# EasyEDA Pro project hackbash.eprj

# Schematic hackbash
Board Name: hackbash; Create Date: 2025-10-17; Page Name: hackbash; Project Name: hackbash; Schematic Name: hackbash; Update Date: 2025-10-17; File: hackbash; Id: /; Sheet: /
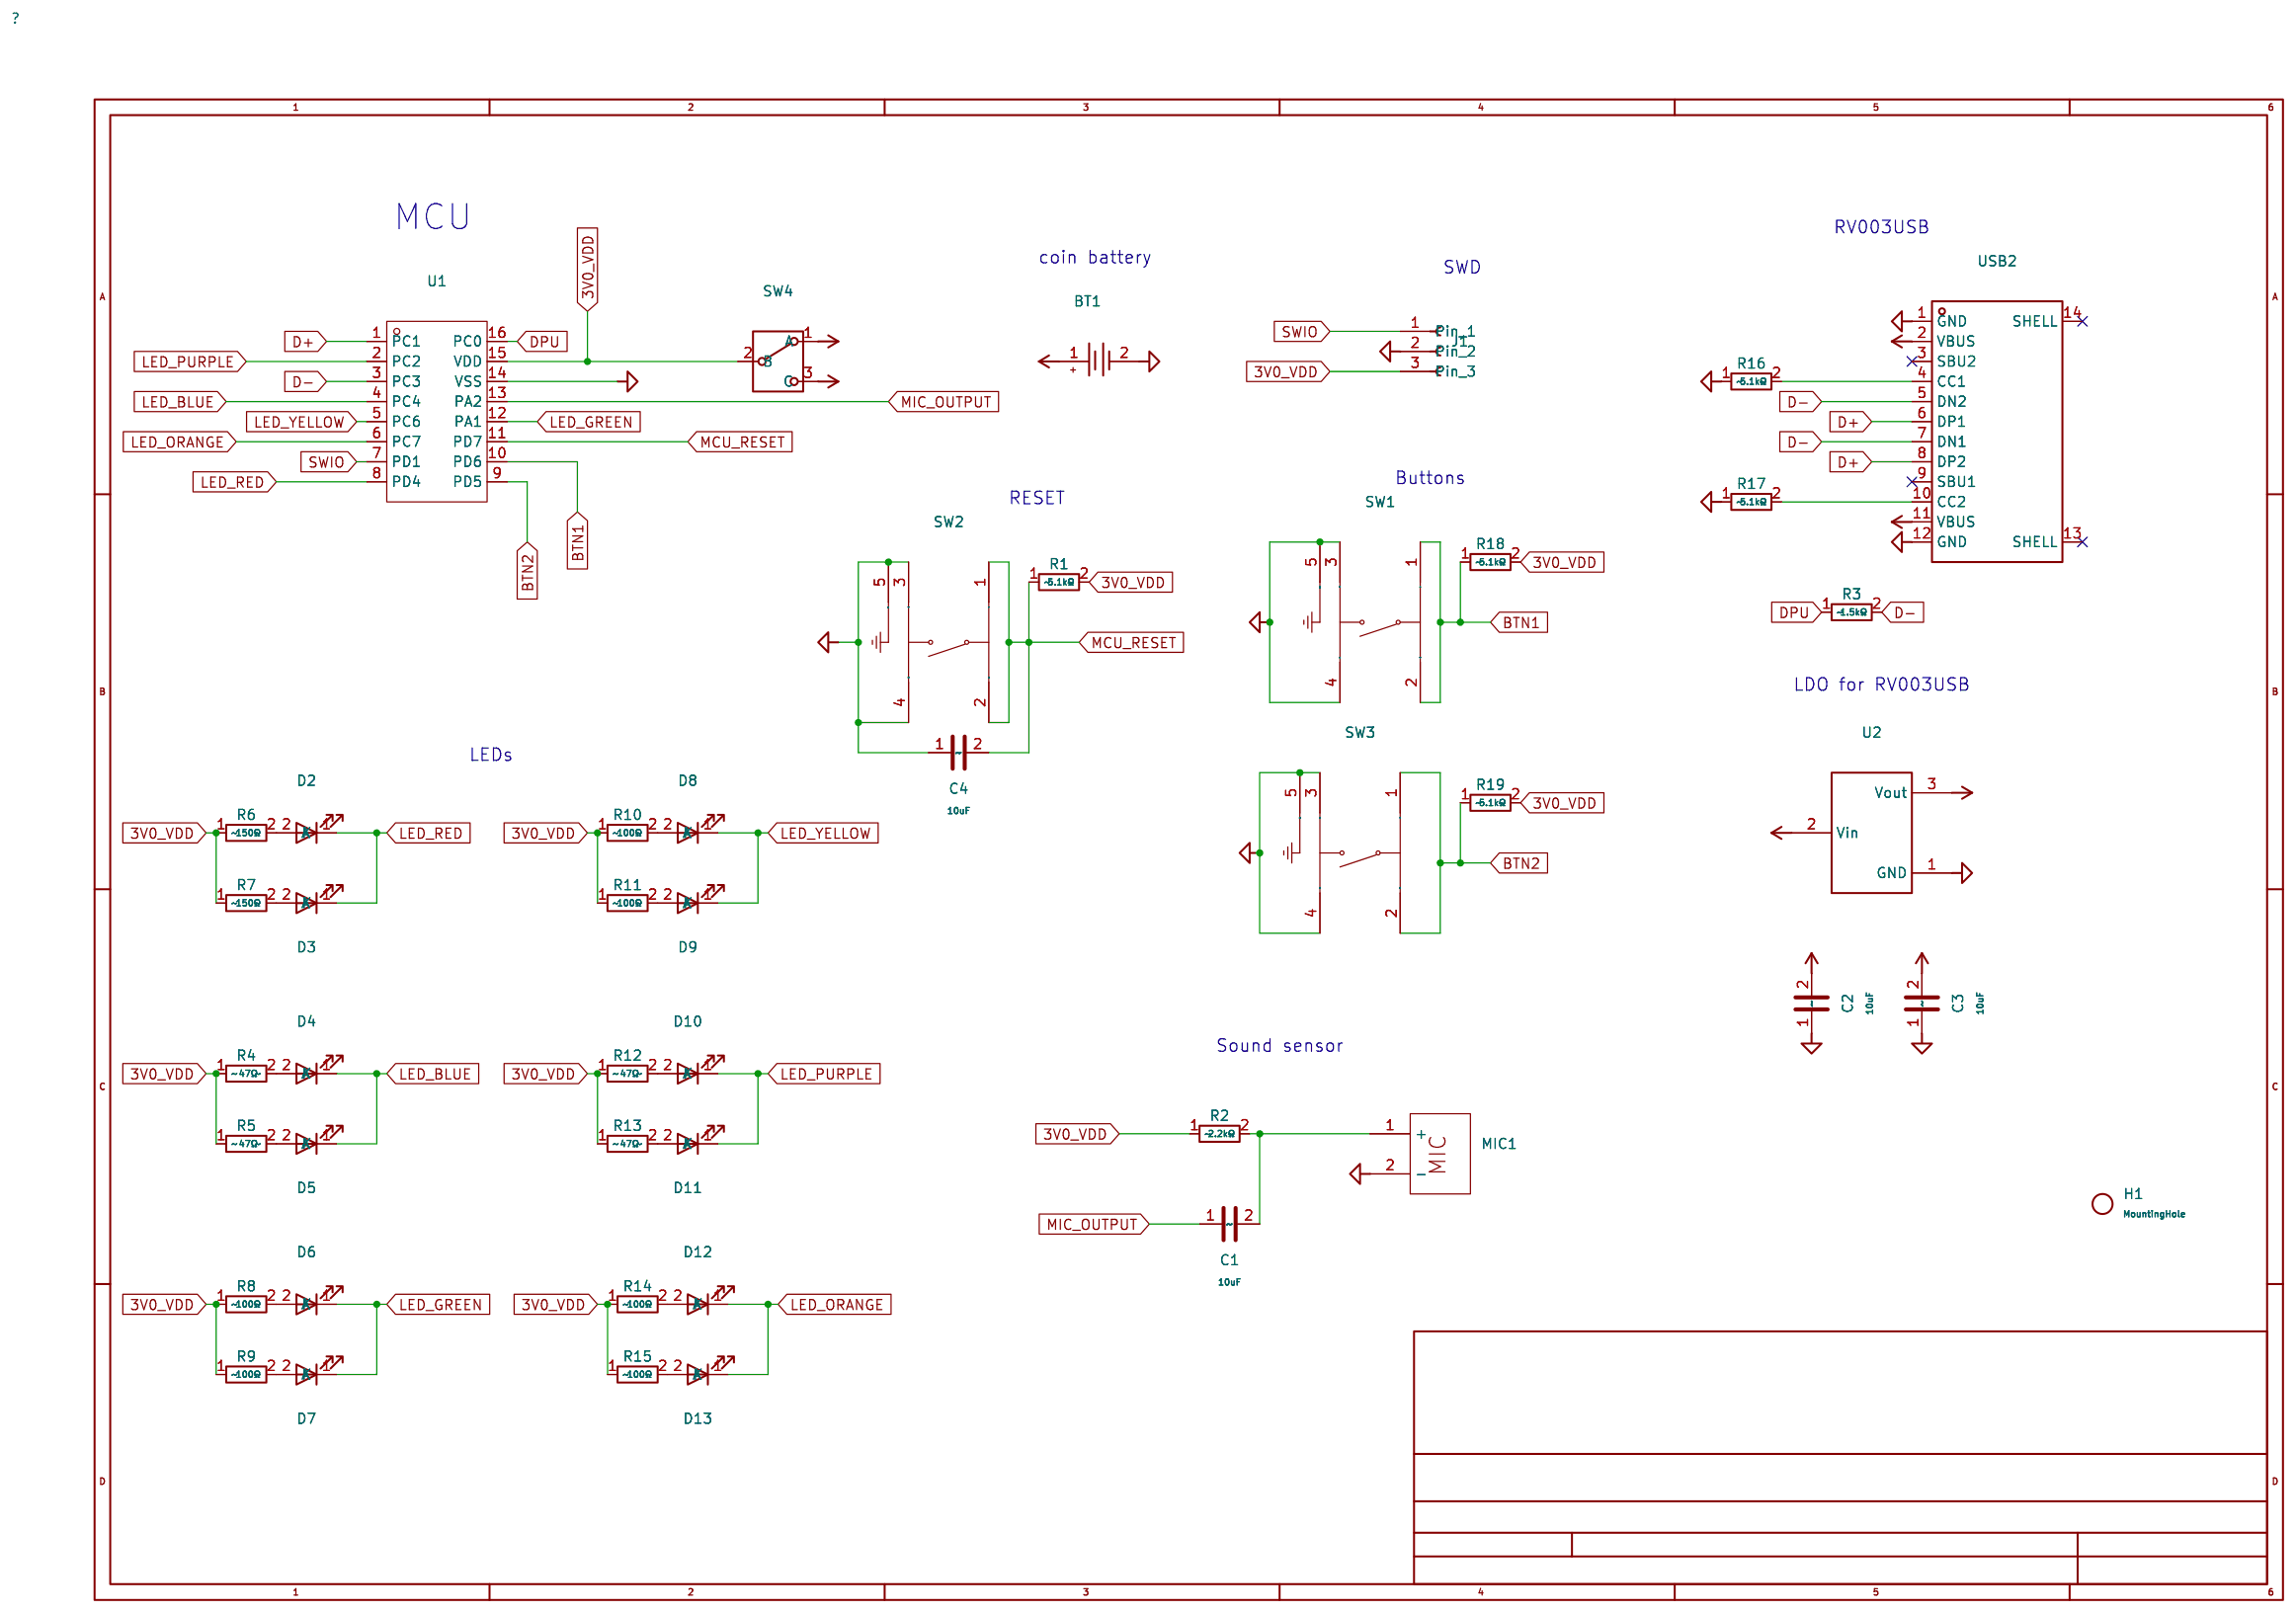
[diagram p0: schematic sheet]

## Parts
BT1  CR2032弯脚电池片铜 3V  [BAT-SMD_CR2032-3V]
C1  10uF  [C0805]
C2  10uF  [C0805]
C3  10uF  [C0805]
C4  10uF  [C0805]
D2  F.0805.00006/P2-0805R1TS2-08T-002  [LED0805-R-RD]
D3  F.0805.00006/P2-0805R1TS2-08T-002  [LED0805-R-RD]
D4  XL-2012UBC-A  [LED-SMD_L2.0-W1.3-RD_XL-2012UGC-DS]
D5  XL-2012UBC-A  [LED-SMD_L2.0-W1.3-RD_XL-2012UGC-DS]
D6  F.0805.00004/P2-0805G2TS2-08T-002  [LED0805-R-RD_GREEN]
D7  F.0805.00004/P2-0805G2TS2-08T-002  [LED0805-R-RD_GREEN]
D8  XL-2012UYC  [LED0805-RD_YELLOW]
D9  XL-2012UYC  [LED0805-RD_YELLOW]
D10  F.0805.00034/P2-0805W7YS2-08T-006  [LED0805-RD]
D11  F.0805.00034/P2-0805W7YS2-08T-006  [LED0805-RD]
D12  XL-2012UOC  [LED0805-RD_ORANGE]
D13  XL-2012UOC  [LED0805-RD_ORANGE]
H1  MountingHole  [MountingHole:MountingHole_3.2mm_M3_DIN965_Pad]
J1  WAFER-XH254WZ-3AL  [CONN-TH_WAFER-XH254WZ-3A]
MIC1  MIC-4013-G-G00  [MIC-SMD_BD4.0-4013_SMDA]
R1  5.1kΩ  [R0805]
R2  2.2kΩ  [R0805]
R3  1.5kΩ  [R0805]
R4  47Ω  [R0805]
R5  47Ω  [R0805]
R6  150Ω  [R0805]
R7  150Ω  [R0805]
R8  100Ω  [R0805]
R9  100Ω  [R0805]
R10  100Ω  [R0805]
R11  100Ω  [R0805]
R12  47Ω  [R0805]
R13  47Ω  [R0805]
R14  100Ω  [R0805]
R15  100Ω  [R0805]
R16  5.1kΩ  [R0805]
R17  5.1kΩ  [R0805]
R18  5.1kΩ  [R0805]
R19  5.1kΩ  [R0805]
SW1  HX TS3315A-H 250gf  [SW-SMD_4P-L3.4-W3.4-P2.00-LS4.0_TS3315A160GF]
SW2  HX TS3315A-H 250gf  [SW-SMD_4P-L3.4-W3.4-P2.00-LS4.0_TS3315A160GF]
SW3  HX TS3315A-H 250gf  [SW-SMD_4P-L3.4-W3.4-P2.00-LS4.0_TS3315A160GF]
SW4  MST-22D18G4-WT  [SW-SMD_MST-22D18G4-WT]
U1  CH32V003A4M6  [SOIC-16_L9.9-W3.9-P1.27-LS6.0-BL]
U2  XC6206P332MR-G  [SOT-23-3_L2.9-W1.6-P1.90-LS2.8-BR]
USB2  TYPE-C 16PIN 2MD(073)  [USB-C-SMD_TYPE-C-6PIN-2MD-073]

## Library data of the parts
BT1 = CR2032弯脚电池片铜 3V: Connector Type:Battery Clip Battery Type:CR2032 Operating Temperature:- Operating Temperature:-; Supplier Part: C70373; Manufacturer: QIJEY; Supplier Footprint: SMD; JLCPCB Part Class: Extended Part; Datasheet: https://item.szlcsc.com/datasheet/CR2032%25E5%25BC%25AF%25E8%2584%259A%25E7%2594%25B5%25E6%25B1%25A0%25E7%2589%2587%25E9%2593%259C%25203V/71468.html; Supplier: LCSC; Connector Type: Battery Clip; Battery Type: CR2032
C1-C4 = CL21A106KAYNNNE_C15850: Capacitance:10uF Tolerance:±10% Tolerance:±10% Voltage Rating:25V Temperature Coefficient:X5R; LCSC Part Name: 10uF ±10% 25V; Supplier Part: C15850; Manufacturer: SAMSUNG(三星); Manufacturer Part: CL21A106KAYNNNE; Supplier Footprint: 0805; JLCPCB Part Class: Basic Part; Datasheet: https://item.szlcsc.com/datasheet/CL21A106KAYNNNE/16532.html; Supplier: LCSC; Tolerance: ±10%; Voltage Rating: 25V; Temperature Coefficient: X5R
D2 D3 = F.0805.00006/P2-0805R1TS2-08T-002: Illumination Color:Red Forward Current:- Lens Color:- Viewing Angle:120° Operating Temperature:-40℃~+85℃ Operating Temperature:-40℃~+85℃; Supplier Part: C7496834; Manufacturer: TUOZHAN(拓展光电); Supplier Footprint: 0805; JLCPCB Part Class: Extended Part; Datasheet: https://item.szlcsc.com/datasheet/F.0805.00006%252FP2-0805R1TS2-08T-002/8563198.html; Supplier: LCSC; Illumination Color: Red; Viewing Angle: 120°; Operating Temperature: -40℃~+85℃
D4 D5 = XL-2012UBC-A_C7371912: Lamp Holder Type:- Illumination Color:Blue Voltage - Forward(Vf):2.6V~2.9V Voltage - Forward(Vf):2.6V~2.9V Power(Watts):100mW Forward Current:5mA Wavelength - Dominant:456nm~476nm Wavelength - Dominant:456nm~476nm Peak Wavelength:465nm Diode Configuration; LCSC Part Name: 0805高亮蓝贴片式发光二极管; Supplier Part: C7371912; Manufacturer: XINGLIGHT(成兴光); Supplier Footprint: 0805; JLCPCB Part Class: Extended Part; Datasheet: https://item.szlcsc.com/datasheet/XL-2012UBC-A/8342984.html; Supplier: LCSC; Illumination Color: Blue; Voltage - Forward(Vf): 2.6V~2.9V; Power(Watts): 100mW; Forward Current: 5mA; Wavelength - Dominant: 456nm~476nm; Peak Wavelength: 465nm; Lens Color: Water Clear; Luminous Intensity: 300mcd; Viewing Angle: 130°; Mounting Style: op View Mount; Operating Temperature: -40℃~+85℃
D6 D7 = F.0805.00004/P2-0805G2TS2-08T-002: Illumination Color:Emerald Green Forward Current:- Lens Color:- Viewing Angle:120° Operating Temperature:-40℃~+85℃ Operating Temperature:-40℃~+85℃; Supplier Part: C7496832; Manufacturer: TUOZHAN(拓展光电); Supplier Footprint: 0805; JLCPCB Part Class: Extended Part; Datasheet: https://item.szlcsc.com/datasheet/F.0805.00004%252FP2-0805G2TS2-08T-002/8563196.html; Supplier: LCSC; Illumination Color: Emerald Green; Viewing Angle: 120°; Operating Temperature: -40℃~+85℃
D8 D9 = XL-2012UYC: Lamp Holder Type:- Illumination Color:Yellow Voltage - Forward(Vf):2.3V Voltage - Forward(Vf):2.3V Power(Watts):50mW Forward Current:20mA Wavelength - Dominant:585nm~595nm Wavelength - Dominant:585nm~595nm Peak Wavelength:590nm Diode Configuration:- Lens; LCSC Part Name: 0805黄贴片式发光二极管; Supplier Part: C965814; Manufacturer: XINGLIGHT(成兴光); Supplier Footprint: 0805; JLCPCB Part Class: Extended Part; Datasheet: https://item.szlcsc.com/datasheet/XL-2012UYC/1051423.html; Supplier: LCSC; Illumination Color: Yellow; Voltage - Forward(Vf): 2.3V; Power(Watts): 50mW; Forward Current: 20mA; Wavelength - Dominant: 585nm~595nm; Peak Wavelength: 590nm; Lens Color: Water Clear; Luminous Intensity: 535mcd; Viewing Angle: 120°; Mounting Style: op View Mount
D10 D11 = F.0805.00034/P2-0805W7YS2-08T-006: Lamp Holder Type:- Illumination Color:Purple Voltage - Forward(Vf):2.6V~3V Voltage - Forward(Vf):2.6V~3V Power(Watts):90mW Forward Current:5mA Wavelength - Dominant:- Wavelength - Dominant:- Peak Wavelength:- Diode Configuration:- Lens Color:Water Clear C; LCSC Part Name: 0805紫罗兰; Supplier Part: C7496841; Manufacturer: TUOZHAN(拓展光电); Supplier Footprint: 0805; JLCPCB Part Class: Extended Part; Datasheet: https://item.szlcsc.com/datasheet/F.0805.00034%252FP2-0805W7YS2-08T-006/8563205.html; Supplier: LCSC; Illumination Color: Purple; Voltage - Forward(Vf): 2.6V~3V; Power(Watts): 90mW; Forward Current: 5mA; Lens Color: Water Clear; Luminous Intensity: 100mcd; Viewing Angle: 120°; Operating Temperature: -40℃~+85℃
D12 D13 = XL-2012UOC: Emitted Color:Orange Forward Voltage (VF):2.3V Forward Voltage (VF):2.3V Power Dissipation:50mW Forward Current:20mA Dominant Wavelength:600nm~610nm Dominant Wavelength:600nm~610nm Peak Wavelength:605nm Lens Color:Colorless transparent lens Color Temperat; Supplier Part: C965813; Manufacturer: XINGLIGHT(成兴光); Supplier Footprint: 0805; JLCPCB Part Class: Extended Part; Datasheet: https://atta.szlcsc.com/upload/public/pdf/source/20240218/D1CE7F0515D7DB5A770105D8481191D9.pdf; Supplier: LCSC; Emitted Color: Orange; Forward Voltage (VF): 2.3V; Power Dissipation: 50mW; Forward Current: 20mA; Dominant Wavelength: 600nm~610nm; Peak Wavelength: 605nm; Lens Color: Colorless transparent lens; Luminous Intensity: 330mcd; Viewing Angle: 120°; Mounting Sytle: Positive Stick; Operating Temperature: -20℃~+85℃
H1 = Mechanical_MountingHole: Mounting Hole without connection; Users: REF**
J1 = WAFER-XH254WZ-3AL: Pins Structure:1x3P Pitch:2.54mm Mounting Type:Right Angle Reference Series:XH Number of Pins:3P Number of Rows:1 Number of PINs Per Row:3 Current Rating:3A Contact Material:Brass Operating Temperature:-25℃~+85℃ Operating Temperature:-25℃~+85℃ Voltage Rat; LCSC Part Name: 1x3P 间距:2.54mm 弯插 系列:XH; Supplier Part: C22751805; Manufacturer: HANBO(汉博); Supplier Footprint: 弯插,P=2.54mm; JLCPCB Part Class: Extended Part; Datasheet: https://item.szlcsc.com/datasheet/WAFER-XH254WZ-3AL/24478740.html; Supplier: LCSC; Pins Structure: 1x3P; Pitch: 2.54mm; Mounting Type: Right Angle; Reference Series: XH; Number of Pins: 3P; Number of Rows: 1; Number of PINs Per Row: 3; Current Rating: 3A; Contact Material: Brass; Operating Temperature: -25℃~+85℃; Voltage Rating: 250V; Plastic Material: PA66; Flame Retardant Rating: UL94V-0
MIC1 = MIC-4013-G-G00: Supplier Part: C42371093; Manufacturer: SAMZO(三佐); Supplier Footprint: SMD,D=4mm; JLCPCB Part Class: Extended Part; Datasheet: https://item.szlcsc.com/datasheet/MIC-4013-G-G00/44248913.html; Supplier: LCSC
R1 R16-R19 = 0805W8F5101T5E: Type:Thick Film Resistor Resistance:5.1kΩ Tolerance:±1% Tolerance:±1% Power(Watts):125mW Voltage-Supply(Max):150V Temperature Coefficient:±100ppm/℃ Temperature Coefficient:±100ppm/℃ Operating Temperature:-55℃~+155℃ Operating Temperature:-55℃~+155℃; LCSC Part Name: 5.1kΩ ±1% 125mW 厚膜电阻; Supplier Part: C27834; Manufacturer: UNI-ROYAL(厚声); Supplier Footprint: 0805; JLCPCB Part Class: Basic Part; Datasheet: https://item.szlcsc.com/datasheet/0805W8F5101T5E/28584.html; Supplier: LCSC; Type: Thick Film Resistor; Tolerance: ±1%; Power(Watts): 125mW; Voltage-Supply(Max): 150V; Temperature Coefficient: ±100ppm/℃; Operating Temperature: -55℃~+155℃
R2 = 0805W8F2201T5E_C17520: Type:Thick Film Resistors Resistance:2.2kΩ Tolerance:±1% Tolerance:±1% Power(Watts): Overload Voltage (Max): Temperature Coefficient:±100ppm/℃ Temperature Coefficient:±100ppm/℃ Operating Temperature Range:-55℃~+155℃ Operating Temperature Range:-55℃~+155℃; LCSC Part Name: 2.2kΩ ±1% 125mW 厚膜电阻; Supplier Part: C17520; Manufacturer: UNI-ROYAL(厚声); Manufacturer Part: 0805W8F2201T5E; Supplier Footprint: 0805; JLCPCB Part Class: Basic Part; Datasheet: https://atta.szlcsc.com/upload/public/pdf/source/20200306/C422600_1E6D84923E4A46A82E41ADD87F860B5C.pdf; Supplier: LCSC; Type: Thick Film Resistors; Tolerance: ±1%; Temperature Coefficient: ±100ppm/℃; Operating Temperature Range: -55℃~+155℃
R3 = 0805W8F1501T5E: Type:Thick Film Resistors Resistance:1.5kΩ Tolerance:±1% Tolerance:±1% Power(Watts): Overload Voltage (Max): Temperature Coefficient:±100ppm/℃ Temperature Coefficient:±100ppm/℃ Operating Temperature Range:-55℃~+155℃ Operating Temperature Range:-55℃~+155℃; LCSC Part Name: 1.5kΩ ±1% 125mW 厚膜电阻; Supplier Part: C4310; Manufacturer: UNI-ROYAL(厚声); Supplier Footprint: 0805; JLCPCB Part Class: Basic Part; Datasheet: https://atta.szlcsc.com/upload/public/pdf/source/20200306/C422600_1E6D84923E4A46A82E41ADD87F860B5C.pdf; Supplier: LCSC; Type: Thick Film Resistors; Tolerance: ±1%; Temperature Coefficient: ±100ppm/℃; Operating Temperature Range: -55℃~+155℃
R4 R5 R12 R13 = 0805W8F470JT5E: Type:Thick Film Resistor Resistance:47Ω Tolerance:±1% Tolerance:±1% Power(Watts):125mW Voltage-Supply(Max):150V Temperature Coefficient:±100ppm/℃ Temperature Coefficient:±100ppm/℃ Operating Temperature:-55℃~+155℃ Operating Temperature:-55℃~+155℃; LCSC Part Name: 47Ω ±1% 125mW 厚膜电阻; Supplier Part: C17714; Manufacturer: UNI-ROYAL(厚声); Supplier Footprint: 0805; JLCPCB Part Class: Basic Part; Datasheet: https://item.szlcsc.com/datasheet/0805W8F470JT5E/18402.html; Supplier: LCSC; Type: Thick Film Resistor; Tolerance: ±1%; Power(Watts): 125mW; Voltage-Supply(Max): 150V; Temperature Coefficient: ±100ppm/℃; Operating Temperature: -55℃~+155℃
R6 R7 = 0805W8F1500T5E: Type:Thick Film Resistor Resistance:150Ω Tolerance:±1% Tolerance:±1% Power(Watts):125mW Voltage-Supply(Max):150V Temperature Coefficient:±100ppm/℃ Temperature Coefficient:±100ppm/℃ Operating Temperature:-55℃~+155℃ Operating Temperature:-55℃~+155℃; LCSC Part Name: 150Ω ±1% 125mW 厚膜电阻; Supplier Part: C17471; Manufacturer: UNI-ROYAL(厚声); Supplier Footprint: 0805; JLCPCB Part Class: Basic Part; Datasheet: https://item.szlcsc.com/datasheet/0805W8F1500T5E/18159.html; Supplier: LCSC; Type: Thick Film Resistor; Tolerance: ±1%; Power(Watts): 125mW; Voltage-Supply(Max): 150V; Temperature Coefficient: ±100ppm/℃; Operating Temperature: -55℃~+155℃
R8-R11 R14 R15 = 0805W8F1000T5E_C17408: Type:Thick Film Resistors Resistance: Tolerance:±1% Tolerance:±1% Power(Watts): Overload Voltage (Max): Temperature Coefficient:±100ppm/℃ Temperature Coefficient:±100ppm/℃ Operating Temperature Range:-55℃~+155℃ Operating Temperature Range:-55℃~+155℃; LCSC Part Name: 100Ω ±1% 125mW 厚膜电阻; Supplier Part: C17408; Manufacturer: UNI-ROYAL(厚声); Manufacturer Part: 0805W8F1000T5E; Supplier Footprint: 0805; JLCPCB Part Class: Basic Part; Datasheet: https://atta.szlcsc.com/upload/public/pdf/source/20200306/C422600_1E6D84923E4A46A82E41ADD87F860B5C.pdf; Supplier: LCSC; Type: Thick Film Resistors; Tolerance: ±1%; Temperature Coefficient: ±100ppm/℃; Operating Temperature Range: -55℃~+155℃
SW1-SW3 = HX TS3315A-H 250gf: Switch Length:3.1mm Switch Width:3.1mm Switch Height:1.5mm Mechanical Life:-; LCSC Part Name: 3.1*3.1*1.5mm 立贴 轻触开关; Supplier Part: C5143623; Manufacturer: hanxia(韩下); Supplier Footprint: SMD; JLCPCB Part Class: Extended Part; Datasheet: https://atta.szlcsc.com/upload/public/pdf/source/20220824/BDB19683E1006CDC20D6384D0C56BE08.pdf; Supplier: LCSC; Switch Length: 3.1mm; Switch Width: 3.1mm; Switch Height: 1.5mm
SW4 = MST-22D18G4-WT: Circuit:DPDT Actuator Style:Rectangular column Termination Style:SMDSplicing Mounting Type:Horizontal attachment Current Rating:100mA Voltage Rating:12V Life:10,000 times Operating Temperature:-10℃~+50℃ Operating Temperature:-10℃~+50℃; LCSC Part Name: 两档卧式贴片 6脚拨动 柄长4MM; Supplier Part: C7507448; Manufacturer: SHOU HAN(首韩); Supplier Footprint: SMD; JLCPCB Part Class: Extended Part; Datasheet: https://item.szlcsc.com/datasheet/MST-22D18G4-WT/8598470.html; Supplier: LCSC; Circuit: DPDT; Actuator Style: Rectangular column; Termination Style: SMDSplicing; Mounting Type: Horizontal attachment; Current Rating: 100mA; Voltage Rating: 12V; Life: 10,000 times; Operating Temperature: -10℃~+50℃
U1 = CH32V003A4M6: LCSC Part Name: QingKe V2微处理器; Supplier Part: C5346357; Manufacturer: WCH(南京沁恒); Supplier Footprint: SOP-16; JLCPCB Part Class: Extended Part; Datasheet: https://item.szlcsc.com/datasheet/CH32V003A4M6/6127783.html; Supplier: LCSC
U2 = XC6206P332MR-G_C5446: Output Type:Fixed Voltage - Supply:6V Output Voltage:3.3V Output Voltage:3.3V Output Current:200mA Power Supply Rejection Ratio (PSRR):- Voltage Dropout:- standby current:1uA Features:Over Current Protection Operating Temperature:-40℃~+85℃@(Ta) Operating; LCSC Part Name: 输入6V 输出3.3V 200mA; Supplier Part: C5446; Manufacturer: TOREX(特瑞仕); Supplier Footprint: SOT-23-3L; JLCPCB Part Class: Basic Part; Datasheet: https://item.szlcsc.com/datasheet/XC6206P332MR-G/5896.html; Supplier: LCSC; Output Type: Fixed; Voltage - Supply: 6V; Output Voltage: 3.3V; Output Current: 200mA; standby current: 1uA; Features: Over Current Protection; Operating Temperature: -40℃~+85℃@(Ta); Output Configuration: Positive; Number of Outputs: 1
USB2 = TYPE-C 16PIN 2MD(073): Connector Type:Type-C Protocol Standard:- Gender:Female Mounting Type:Surface Mount, Right Angle Number of Contacts:16P Number of Ports:1 Current Rating-Power:3A Voltage Rating:5V Connect-Disconnect Life:5,000 Cycles Supplementary Features:- Center Height; LCSC Part Name: Type-C 母 卧贴; Supplier Part: C2765186; Manufacturer: SHOU HAN(首韩); Supplier Footprint: SMD; JLCPCB Part Class: Extended Part; Datasheet: https://item.szlcsc.com/datasheet/TYPE-C%252016PIN%25202MD(073)/2901843.html; Supplier: LCSC; Connector Type: Type-C; Gender: Female; Mounting Type: Surface Mount, Right Angle; Number of Contacts: 16P; Number of Ports: 1; Current Rating-Power: 3A; Voltage Rating: 5V; Connect-Disconnect Life: 5,000 Cycles; Detection color: Black; Operating Temperature: -25℃~+85℃

## Nets
3V0_VDD: J1.3(Pin) R1.2 R2.1 R4.1 R5.1 R6.1 R7.1 R8.1 R9.1 R10.1 R11.1 R12.1 R13.1 R14.1 R15.1 R18.2 R19.2 SW4.2(B) U1.15(VDD)
BTN1: R18.1 SW1.1(A) SW1.2(B) U1.10(PD6)
BTN2: R19.1 SW3.1(A) SW3.2(B) U1.9(PD5)
D+: U1.1(PC1) USB2.6(DP1) USB2.8(DP2)
D-: R3.2 U1.3(PC3) USB2.5(DN2) USB2.7(DN1)
DPU: R3.1 U1.16(PC0)
LED_BLUE: D4.1(K) D5.1(K) U1.4(PC4)
LED_GREEN: D6.1(K) D7.1(K) U1.12(PA1)
LED_ORANGE: D12.1(K) D13.1(K) U1.6(PC7)
LED_PURPLE: D10.1(K) D11.1(K) U1.2(PC2)
LED_RED: D2.1(K) D3.1(K) U1.8(PD4)
LED_YELLOW: D8.1(K) D9.1(K) U1.5(PC6)
MCU_RESET: C4.2 R1.1 SW2.1(A) SW2.2(B) U1.11(PD7)
MIC_OUTPUT: C1.1 U1.13(PA2)
POWER_+3V0: BT1.1 SW4.3(C)
POWER_+5V: C2.2 U2.2(Vin) USB2.2(VBUS) USB2.11(VBUS)
POWER_GND: BT1.2 C2.1 C3.1 C4.1 J1.2(Pin) MIC1.2(-) R16.1 R17.1 SW1.3(C) SW1.4(D) SW1.5(GND) SW2.3(C) SW2.4(D) SW2.5(GND) SW3.3(C) SW3.4(D) SW3.5(GND) U1.14(VSS) U2.1(GND) USB2.1(GND) USB2.12(GND)
POWER_VDD: C3.2 SW4.1(A) U2.3(Vout)
SWIO: J1.1(Pin) U1.7(PD1)
$1N35: C1.2 MIC1.1(+) R2.2
$1N37: R17.2 USB2.10(CC2)
$1N48: R16.2 USB2.4(CC1)
$1N986: D6.2(A) R8.2
$1N987: D7.2(A) R9.2
$1N988: D3.2(A) R7.2
$1N999: D11.2(A) R13.2
$1N1000: D8.2(A) R10.2
$1N1001: D10.2(A) R12.2
$1N1002: D5.2(A) R5.2
$1N1003: D9.2(A) R11.2
$1N1008: D12.2(A) R14.2
$1N1021: D13.2(A) R15.2
$1N1032: D2.2(A) R6.2
$1N1035: D4.2(A) R4.2

Not connected (* = marked no-connect by the designer): USB2 3(SBU2)* 9(SBU1)* 13(SHELL)* 14(SHELL)*

## Notes on the sheet
- MCU
- RV003USB
- coin battery
- SWD
- Buttons
- RESET
- LDO for RV003USB
- LEDs
- Sound sensor

# Board hackbash
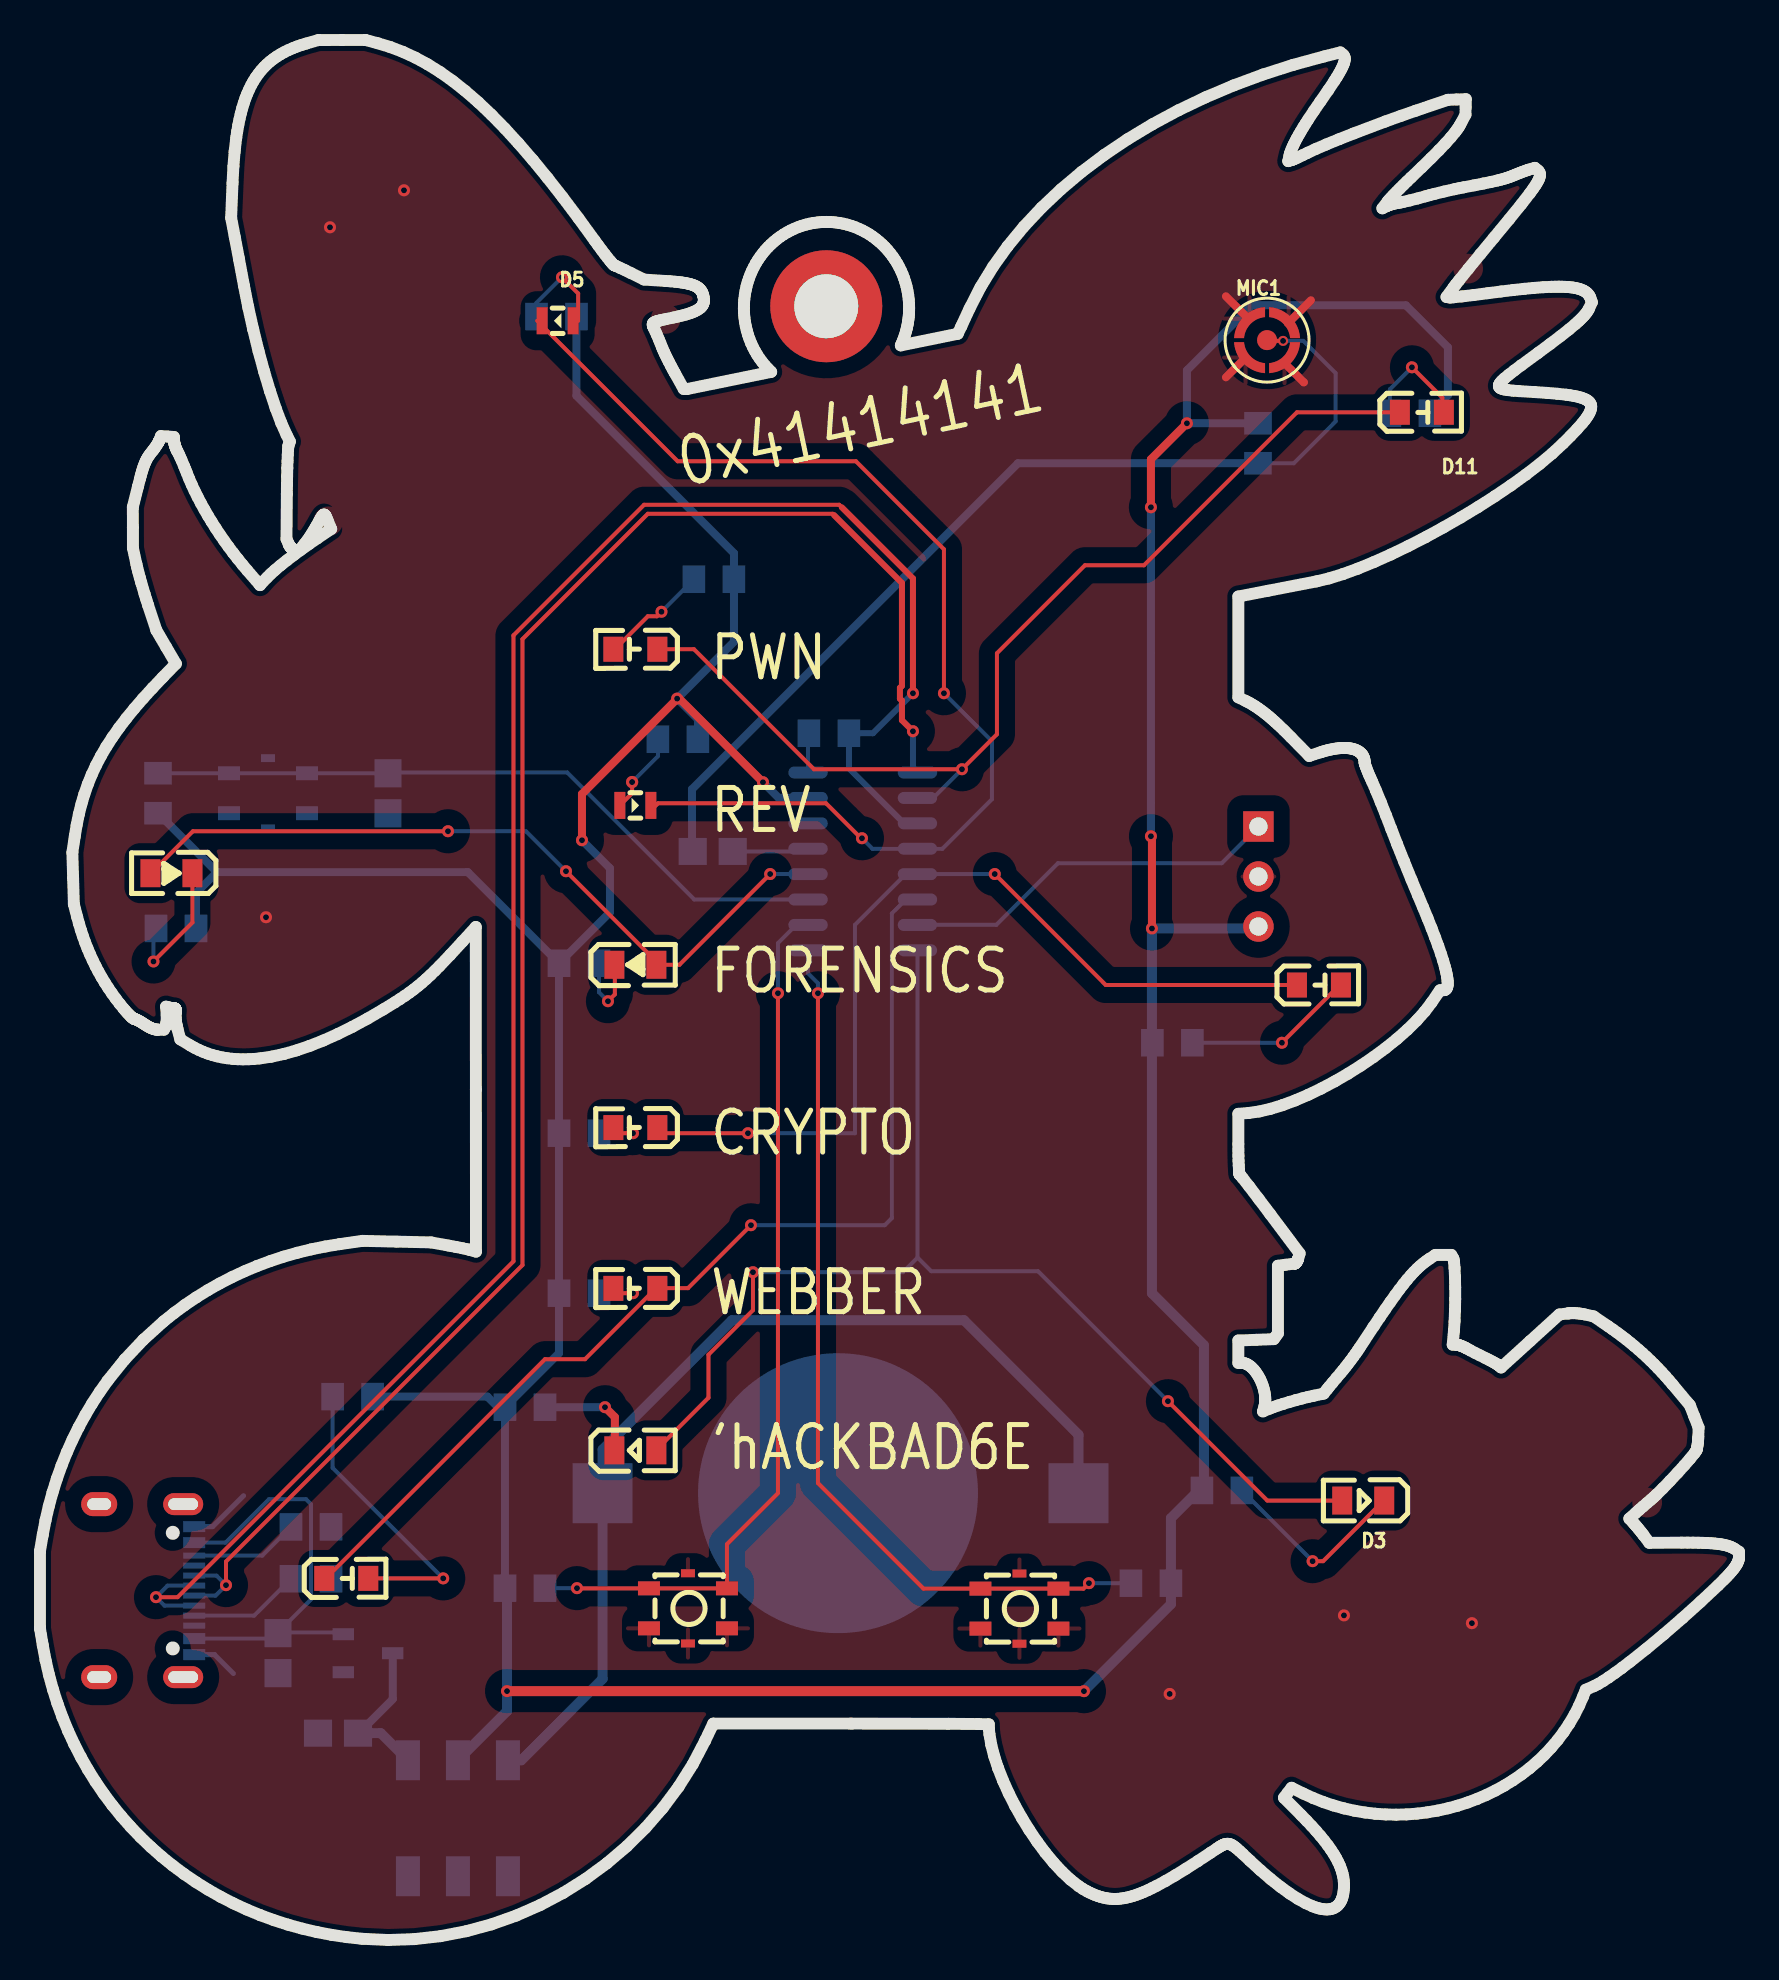
[diagram p1: board, top side]
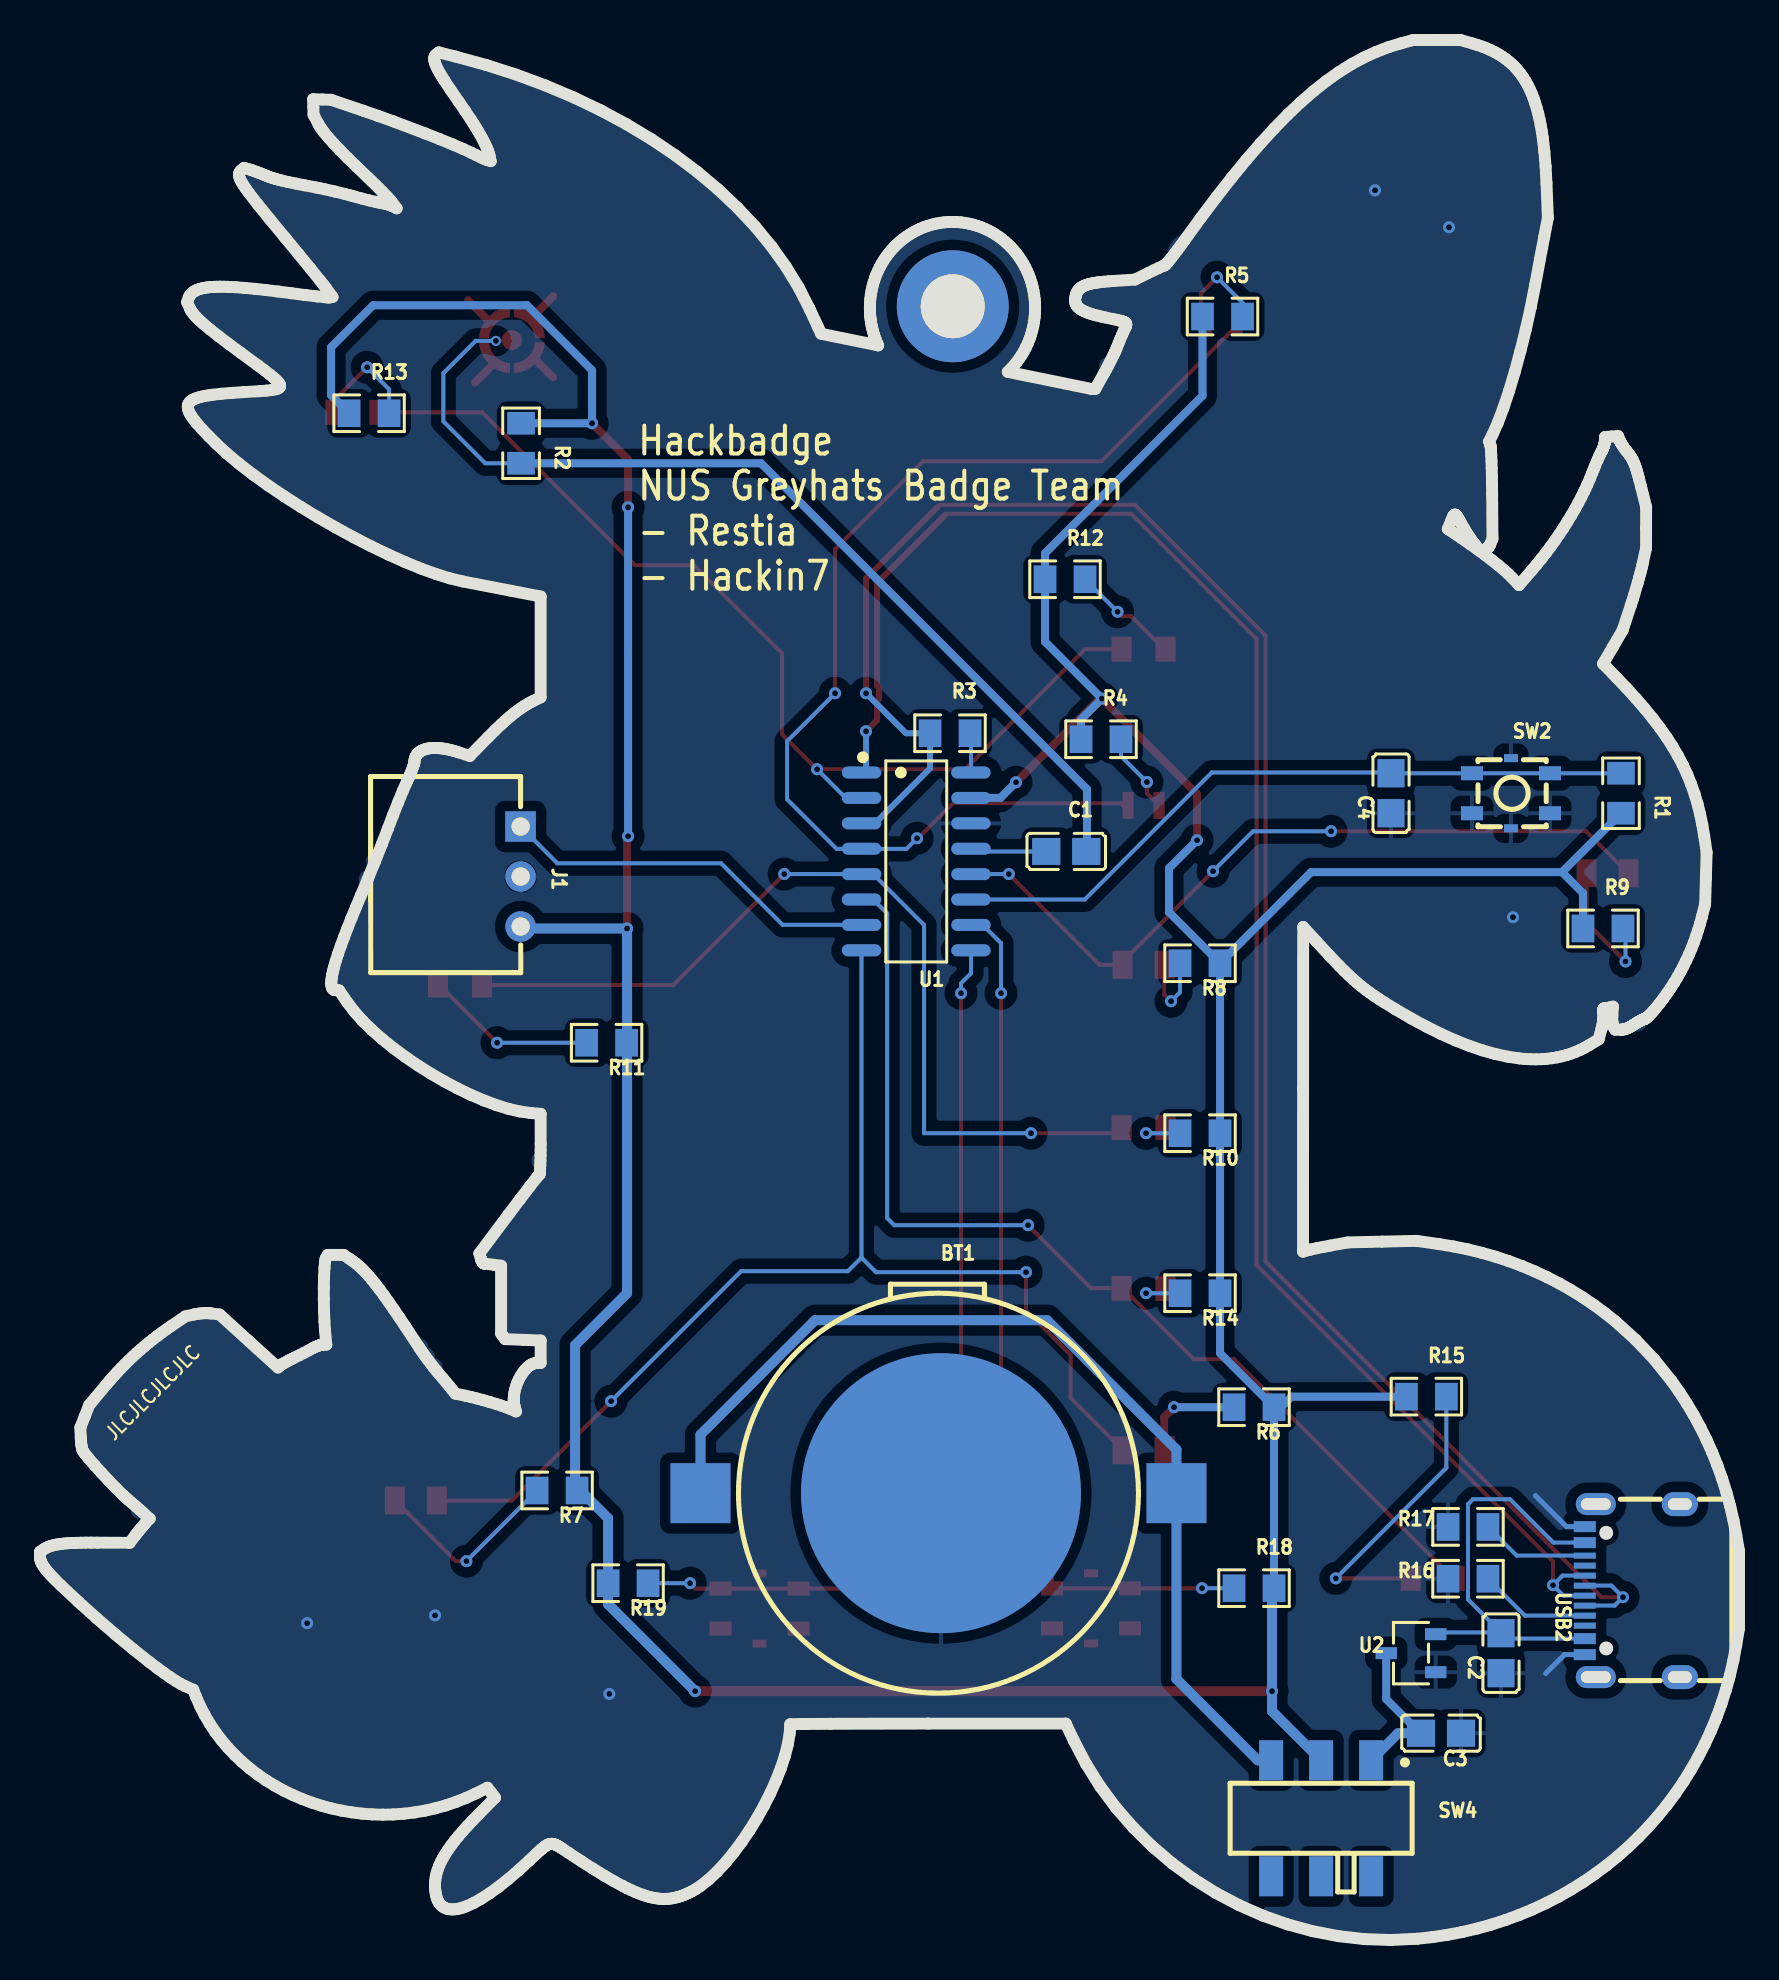
[diagram p2: board, bottom side, seen from below]

Outline 84.96 x 95.01 mm; copper layers: Top Layer, Bottom Layer. Coordinates in mm from the lower left corner of the outline.
Stack: Top Layer 0.035mm / Dielectric1 1.51mm FR4 er 4.5 / Bottom Layer 0.035mm

## Design rules (mm)
template: User Custom Config
spacing safeClearance (default): track to track 0, other pairs 0 to 0.5
track width trackWidth (default): min 0.127, default 0.254, max 2.54
differential pair differentialPair (default): width min 0.127, default 0.254, max 2.54; gap min 0.152, default 0.152
via viaSize (default): diameter min 0.5, default 0.61, max 10; hole min 0.3, default 0.305, max 6
pour ie756 uses CopperRegion
pour ie757 uses CopperRegion1

## Placement (name value [footprint] x y rotation side)
BT1  CR2032弯脚电池片铜 3V  [BAT-SMD_CR2032-3V]  40.03 22.34 270 bottom
C1  10uF  [C0805]  33.64 54.43 180 bottom
C2  10uF  [C0805]  11.9 14.34 90 bottom
C3  10uF  [C0805]  14.9 10.34 0 bottom
C4  10uF  [C0805]  17.4 57.34 90 bottom
D2  F.0805.00006/P2-0805R1TS2-08T-002  [LED0805-R-RD]  29.77 24.49 0 top
D3  F.0805.00006/P2-0805R1TS2-08T-002  [LED0805-R-RD]  66.17 21.97 180 top
D4  XL-2012UBC-A  [LED-SMD_L2.0-W1.3-RD_XL-2012UGC-DS]  29.77 56.73 180 top
D5  XL-2012UBC-A  [LED-SMD_L2.0-W1.3-RD_XL-2012UGC-DS]  25.88 80.97 0 top
D6  F.0805.00004/P2-0805G2TS2-08T-002  [LED0805-R-RD_GREEN]  29.77 48.77 0 top
D7  F.0805.00004/P2-0805G2TS2-08T-002  [LED0805-R-RD_GREEN]  6.57 53.35 180 top
D8  XL-2012UYC  [LED0805-RD_YELLOW]  29.77 40.62 180 top
D9  XL-2012UYC  [LED0805-RD_YELLOW]  63.95 47.75 0 top
D10  F.0805.00034/P2-0805W7YS2-08T-006  [LED0805-RD]  29.77 64.55 180 top
D11  F.0805.00034/P2-0805W7YS2-08T-006  [LED0805-RD]  69.1 76.39 0 top
D12  XL-2012UOC  [LED0805-RD_ORANGE]  29.77 32.58 180 top
D13  XL-2012UOC  [LED0805-RD_ORANGE]  15.32 18.08 0 top
H1  MountingHole  [MountingHole:MountingHole_3.2mm_M3_DIN965_Pad]  39.32 81.7 0 top
J1  WAFER-XH254WZ-3AL  [CONN-TH_WAFER-XH254WZ-3A]  60.93 53.18 270 bottom
MIC1  MIC-4013-G-G00  [MIC-SMD_BD4.0-4013_SMDA]  61.36 80 0 top
R1  5.1kΩ  [R0805]  5.9 57.34 270 bottom
R2  2.2kΩ  [R0805]  60.9 74.84 270 bottom
R3  1.5kΩ  [R0805]  39.45 60.34 0 bottom
R4  47Ω  [R0805]  31.9 60.04 180 bottom
R5  47Ω  [R0805]  25.83 81.18 180 bottom
R6  150Ω  [R0805]  24.25 26.64 0 bottom
R7  150Ω  [R0805]  59.1 22.48 0 bottom
R8  100Ω  [R0805]  26.95 48.84 0 bottom
R9  100Ω  [R0805]  6.8 50.58 180 bottom
R10  100Ω  [R0805]  26.95 40.34 0 bottom
R11  100Ω  [R0805]  56.63 44.87 0 bottom
R12  47Ω  [R0805]  33.7 68.04 180 bottom
R13  47Ω  [R0805]  68.5 76.35 180 bottom
R14  100Ω  [R0805]  26.95 32.34 0 bottom
R15  100Ω  [R0805]  15.63 27.17 180 bottom
R16  5.1kΩ  [R0805]  13.55 18.07 180 bottom
R17  5.1kΩ  [R0805]  13.55 20.66 180 bottom
R18  5.1kΩ  [R0805]  24.25 17.59 180 bottom
R19  5.1kΩ  [R0805]  55.55 17.84 0 bottom
SW1  HX TS3315A-H 250gf  [SW-SMD_4P-L3.4-W3.4-P2.00-LS4.0_TS3315A160GF]  32.4 16.58 0 top
SW2  HX TS3315A-H 250gf  [SW-SMD_4P-L3.4-W3.4-P2.00-LS4.0_TS3315A160GF]  11.4 57.34 180 bottom
SW3  HX TS3315A-H 250gf  [SW-SMD_4P-L3.4-W3.4-P2.00-LS4.0_TS3315A160GF]  48.97 16.57 0 top
SW4  MST-22D18G4-WT  [SW-SMD_MST-22D18G4-WT]  20.9 6.09 0 bottom
U1  CH32V003A4M6  [SOIC-16_L9.9-W3.9-P1.27-LS6.0-BL]  41.14 53.93 270 bottom
U2  XC6206P332MR-G  [SOT-23-3_L2.9-W1.6-P1.90-LS2.8-BR]  16.4 14.34 180 bottom
USB2  TYPE-C 16PIN 2MD(073)  [USB-C-SMD_TYPE-C-6PIN-2MD-073]  5.33 17.47 90 bottom

## Footprints (pads in the part's own frame, mm; a bottom-side part is the same pattern mirrored in y, then rotated)
BAT-SMD_CR2032-3V
  rect 3x3 smd: 1(0,-11.9) 1(0,11.9)
  round 14 smd: 2(0,0.127)
C0805
  rect 1.41x1.35 smd: 1(-1,0) 2(1,0)
CONN-TH_WAFER-XH254WZ-3A
  rect 1.524x1.524 hole 0.914: 1(-2.5,0)
  round 1.524 hole 0.914: 2(0,0) 3(2.5,0)
LED0805-R-RD
  rect 1x1.399 smd: 1(1.05,0) 2(-1.05,0)
LED0805-R-RD_GREEN
  rect 1x1.399 smd: 1(1.05,0) 2(-1.05,0)
LED0805-RD
  rect 1x1.25 smd: 1(-1.1,0) 2(1.1,0)
LED0805-RD_ORANGE
  rect 1x1.25 smd: 1(-1.1,0) 2(1.1,0)
LED0805-RD_YELLOW
  rect 1x1.25 smd: 1(-1.1,0) 2(1.1,0)
LED-SMD_L2.0-W1.3-RD_XL-2012UGC-DS
  rect 0.55x1.35 smd: 1(-0.775,0) 2(0.775,0)
MIC-SMD_BD4.0-4013_SMDA
  round 1 smd: 1(0,0)
  custom 1.55x1.55 smd: 2(-1.079,-0.875) 2(-0.875,1.079) 2(0.875,-1.079) 2(1.079,0.875)
MountingHole:MountingHole_3.2mm_M3_DIN965_Pad
  round 5.6 hole 3.2: 1(0,0)
R0805
  rect 1.133x1.377 smd: 1(-1,0) 2(1,0)
SOIC-16_L9.9-W3.9-P1.27-LS6.0-BL
  oval 0.602x1.971 smd: 1(-4.445,-2.736) 2(-3.175,-2.736) 3(-1.905,-2.736) 4(-0.635,-2.736) 5(0.635,-2.736) 6(1.905,-2.736) 7(3.175,-2.736) 8(4.445,-2.736) 9(4.445,2.736) 10(3.175,2.736) 11(1.905,2.736) 12(0.635,2.736) 13(-0.635,2.736) 14(-1.905,2.736) 15(-3.175,2.736) 16(-4.445,2.736)
SOT-23-3_L2.9-W1.6-P1.90-LS2.8-BR
  rect 1.07x0.6 smd: 1(1.235,-0.95) 2(1.235,0.95) 3(-1.235,0)
SW-SMD_4P-L3.4-W3.4-P2.00-LS4.0_TS3315A160GF
  rect 1.1x0.7 smd: 1(-1.95,1) 2(1.95,1) 3(-1.95,-1) 4(1.95,-1)
  rect 0.7x0.4 smd: 5(0,1.755) 5(0,-1.755)
SW-SMD_MST-22D18G4-WT
  rect 1.2x2 smd: 1(-2.5,-2.9) 2(0,-2.9) 3(2.5,-2.9) 4(2.5,2.9) 5(0,2.9) 6(-2.5,2.9)
USB-C-SMD_TYPE-C-6PIN-2MD-073
  rect 0.55x1.1 smd: 1(-3.2,2.375) 2(-2.4,2.375) 11(2.4,2.375) 12(3.2,2.375)
  rect 0.3x1.1 smd: 3(-1.75,2.375) 4(-1.25,2.375) 5(-0.75,2.375) 6(-0.25,2.375) 7(0.25,2.375) 8(0.75,2.375) 9(1.25,2.375) 10(1.75,2.375)
  oval 1.2x1.8 hole 0.6x1.2: 13(-4.325,-2.375) 14(4.325,-2.375)
  oval 1.1x2 hole 0.6x1.5: 13(-4.325,1.825) 14(4.325,1.825)

## Nets
As in the schematic.

Pads without a net: H1 1; SW4 4 5 6; USB2 3 9 13 14

## Via types
v1: diameter 0.6, hole 0.3, Top Layer to Bottom Layer, 45 vias
v2: diameter 0.5, hole 0.3, Top Layer to Bottom Layer, 1 via
v3: diameter 0.61, hole 0.305, Top Layer to Bottom Layer, 1 via

## Routing (per net, layer and track width the routed paths; a pad name or vN(x,y) marks a point on that pad's centre or on a via; arc(x,y) is an arc through that point)
3V0_VDD: length 253.8
  Top Layer w0.4: v1(57.35,75.84) 55.55,74.04 v1(55.55,71.64) ; v1(55.6,50.58) 55.6,55.14 v1(55.55,55.19) ; v1(27.1,54.99) 27.1,57.3 31.86,62.06 v1(31.86,62.08) 31.97,62.08 v1(36.15,57.89)
  Top Layer w0.5: v1(52.2,12.44) 23.35,12.44 v1(23.35,12.45)
  Bottom Layer w0.4: R18.2 R6.1 ; R6.1 22.9,26.64 22.37,27.17 R15.1 ; R6.1 25.95,29.34 R14.1 R10.1 R8.1 ; R13.1 70.4,77.25 70.4,79.64 68.3,81.74 60.6,81.74 57.35,78.49 v1(57.35,75.84) R2.1 ; 27.15,54.99 v1(27.1,54.99) 28.5,53.59 28.5,51.39 R8.1 ; 8.85,53.4 7.8,52.35 R9.1 ; 8.85,53.4 R1.2 ; 8.85,53.4 21.4,53.4 R8.1 ; v1(36.15,57.89) 36.93,57.11 38.4,57.11 ; v1(55.55,55.19) v1(55.55,71.64) ; R5.1 26.83,77.22 34.7,69.34 R12.1 34.7,64.92 v1(31.86,62.08) 32.9,61.03 R4.1
  Bottom Layer w0.5: 23.25,17.54 23.35,17.44 v1(23.35,12.45) 23.35,11.44 SW4.2 ; v1(52.2,12.44) 56.55,16.79 R19.2 56.55,21.09 58.2,22.74 58.2,29.74 55.6,32.34 v1(55.6,50.58) 60.83,50.58 J1.3
BTN1: length 44.3
  Top Layer w0.2: v1(26.85,17.59) 26.86,17.58 SW1.1 SW1.2 34.35,19.79 36.9,22.34 v1(36.9,47.34)
  Bottom Layer w0.2: v1(36.9,47.34) 36.9,49.85 37.82,50.76 38.4,50.76 ; v1(26.85,17.59) R18.1
BTN2: length 44.8
  Top Layer w0.2: v1(38.9,47.34) 38.9,22.84 44.17,17.57 SW3.1 SW3.2 52.18,17.57 v1(52.45,17.84)
  Bottom Layer w0.2: 38.4,49.49 38.4,48.34 38.9,47.84 v1(38.9,47.34) ; R19.1 v1(52.45,17.84)
D+: length 89.9
  Top Layer w0.2: v1(9.3,17.74) 9.3,18.93 24.13,33.75 24.13,65.05 30.39,71.32 39.64,71.32 39.71,71.25
  Top Layer w0.3: 39.71,71.25 43.1,67.85 43.1,62.71 43,62.61 43,62.07 43.1,61.97 43.1,60.99 v1(43.65,60.44)
  Bottom Layer w0.2: 7.71,18.22 8.82,18.22 v1(9.3,17.74) 8.78,17.22 7.71,17.22
  Bottom Layer w0.3: v1(43.65,60.44) 43.65,58.61 43.88,58.38
D-: length 100.7
  Top Layer w0.2: v1(5.8,17.14) 6.88,17.14 23.68,33.94 23.68,65.24 30.21,71.77 39.96,71.77 40.1,71.64
  Top Layer w0.3: v1(43.65,62.34) 43.65,68.08 40.1,71.64
  Bottom Layer w0.2: 7.71,16.72 6.22,16.72 v1(5.8,17.14) 6.38,17.72 7.71,17.72
  Bottom Layer w0.3: v1(43.65,62.34) 41.65,60.34 R3.2 40.45,58.59 43.2,55.84 43.88,55.84
DPU: length 2
  Bottom Layer w0.2: 38.4,58.38 38.4,60.29 R3.1
LED_BLUE: length 57.7
  Top Layer w0.2: v1(45.2,62.34) 45.2,69.54 40.8,73.94 31.89,73.94 24.86,80.97 ; 30.62,56.56 30.9,56.84 39.3,56.84 41.05,55.09 v1(41.1,55.09) 41.2,55.09
  Bottom Layer w0.2: v1(41.1,55.09) 41.63,54.56 45.12,54.56 47.6,57.04 47.6,59.94 v1(45.2,62.34)
LED_GREEN: length 38.6
  Top Layer w0.2: v1(36.51,53.3) 31.97,48.77 30.8,48.77 30.8,48.95 ; 30.8,48.95 30.8,49.05 ; 30.8,48.95 v1(26.3,53.44) ; 5.55,53.35 7.65,55.44 v1(20.4,55.44)
  Bottom Layer w0.2: v1(26.3,53.44) 24.3,55.44 v1(20.4,55.44) ; 38.4,53.3 v1(36.51,53.3)
LED_ORANGE: length 52.6
  Top Layer w0.2: 14.29,18.08 25.25,29.04 27.26,29.04 30.81,32.6 32.4,32.6 v1(35.55,35.74)
  Bottom Layer w0.2: v1(35.55,35.74) 42.24,35.74 42.6,36.1 42.6,51.33 43.3,52.03 43.88,52.03
LED_PURPLE: length 52.3
  Top Layer w0.2: 30.8,64.55 32.7,64.55 38.7,58.54 v1(46.1,58.54) 47.85,60.29 47.85,64.34 52.25,68.74 55.2,68.74 62.85,76.39 68.07,76.39
  Bottom Layer w0.2: 43.88,57.11 44.67,57.11 v1(46.1,58.54)
LED_RED: length 61.1
  Top Layer w0.2: 65.14,21.97 61.37,21.97 v1(56.4,26.94) ; v1(35.65,33.39) 35.65,31.49 33.43,29.27 33.43,27.12 30.8,24.49
  Bottom Layer w0.2: 43.88,34.12 43.88,49.49 ; 43.88,34.12 44.56,33.44 49.9,33.44 v1(56.4,26.94) ; 43.88,34.12 43.15,33.39 v1(35.65,33.39)
LED_YELLOW: length 46
  Top Layer w0.2: v1(35.4,40.34) 31.08,40.34 30.8,40.62 ; 62.93,47.75 53.29,47.75 v1(47.74,53.3)
  Bottom Layer w0.2: v1(47.74,53.3) 43.3,53.3 40.75,50.76 40.75,40.34 v1(35.4,40.34)
MCU_RESET: length 35.1
  Bottom Layer w0.2: 38.4,52.03 32.71,52.03 26.36,58.38 17.4,58.38 17.36,58.34 SW2.1 SW2.2 R1.1
MIC_OUTPUT: length 3.8
  Bottom Layer w0.2: 34.68,54.43 38.27,54.43 38.4,54.56
POWER_+3V0: length 49.7
  Bottom Layer w0.5: BT1.1 51.93,25.26 46.2,30.99 34.6,30.99 28.13,24.52 BT1.1 28.13,13.05 24.06,8.99 SW4.3
POWER_+5V: length 22.2
  Bottom Layer w0.2: 7.71,15.07 11.59,15.07 11.9,15.38 ; 11.44,15.84 11.9,15.38 ; 11.9,15.38 15.07,15.38 15.16,15.29 ; 11.9,15.38 13.55,17.03 13.55,21.79 13.3,22.04 11.45,22.04 9.28,19.87 7.71,19.87
POWER_GND: length 11.6
  Top Layer w0.4: 63.2,77.89 63.19,77.89 62.2,78.88 ; 62.4,80.84 63.55,81.99 ; 60.24,79.08 59.3,78.14 ; 60.45,81.04 59.3,82.19
  Bottom Layer w0.2: 15.07,13.31 15.16,13.39
  Bottom Layer w0.254: 10.18,22.22 8.63,20.67 7.71,20.67 ; 7.71,14.27 8.72,14.27 9.67,13.33
  vias: v1(11.3,51.14) v1(14.5,85.64) v1(18.2,87.49) v1(56.49,12.3) v1(65.2,16.23) v1(71.6,15.84)
POWER_VDD: length 7.8
  Bottom Layer w0.4: 15.94,10.34 17.64,12.05 17.64,14.34
  Bottom Layer w0.5: C3.2 17.04,10.34 SW4.1
SWIO: length 19.1
  Bottom Layer w0.2: J1.1 59.09,53.84 50.9,53.84 47.82,50.76 43.88,50.76
$1N35: length 49.4
  Top Layer w0.2: v2(62.16,79.96) 61.4,79.96 MIC1.1
  Bottom Layer w0.2: v2(62.16,79.96) 63.17,79.96 64.79,78.35 64.79,75.94 62.69,73.84 R2.2
  Bottom Layer w0.4: R2.2 48.9,73.84 32.6,57.54 32.6,56.23 32.6,56.22 32.6,54.43
$1N37: length 5.4
  Bottom Layer w0.2: 7.71,19.22 11.11,19.22 R17.2
$1N48: length 5.6
  Bottom Layer w0.2: 7.71,16.22 10.71,16.22 R16.2
$1N986: length 4.1
  Top Layer w0.2: 28.75,48.77 28.75,47.29 v1(28.4,46.94)
  Bottom Layer w0.2: R8.2 27.95,47.39 v1(28.4,46.94)
$1N987: length 6.9
  Top Layer w0.2: D7.2 7.62,50.88 v1(5.67,48.93)
  Bottom Layer w0.2: v1(5.67,48.93) 5.67,50.46 R9.2
$1N988: length 9.8
  Top Layer w0.2: 67.19,21.97 64.16,18.94 v1(63.64,18.94)
  Bottom Layer w0.2: R7.2 v1(63.64,18.94)
$1N999: length 5.6
  Top Layer w0.2: v1(68.6,78.64) 70.12,77.12 70.12,76.39
  Bottom Layer w0.2: R13.2 67.5,77.54 v1(68.6,78.64)
$1N1000: length 2.7
  Top Layer w0.2: 28.75,40.62 29.03,40.34 v1(29.65,40.34)
  Bottom Layer w0.2: R10.2 v1(29.65,40.34)
$1N1001: length 5.4
  Top Layer w0.2: 28.75,64.55 30.39,66.19 30.85,66.19 v1(31.08,66.42)
  Bottom Layer w0.2: R12.2 v1(31.08,66.42)
$1N1002: length 5
  Top Layer w0.2: v1(26.1,83.14) 26.91,82.34 26.91,80.97
  Bottom Layer w0.2: v1(26.1,83.14) 24.83,81.87 R5.2
$1N1003: length 8.6
  Top Layer w0.2: 64.98,47.75 64.98,47.74 v1(62.1,44.87)
  Bottom Layer w0.2: R11.2 v1(62.1,44.87)
$1N1008: length 2.7
  Top Layer w0.2: v1(29.65,32.34) 28.99,32.34 28.75,32.58
  Bottom Layer w0.2: R14.2 v1(29.65,32.34)
$1N1021: length 15.2
  Top Layer w0.2: v1(20.16,18.08) 16.34,18.08
  Bottom Layer w0.2: R15.2 14.63,23.61 v1(20.16,18.08)
$1N1032: length 5.4
  Top Layer w0.4: 28.75,24.49 28.75,26.15 v1(28.25,26.64)
  Bottom Layer w0.4: R6.2 v1(28.25,26.64)
$1N1035: length 4.1
  Top Layer w0.2: v3(29.61,57.9) 29.61,57.35 D4.2
  Bottom Layer w0.2: R4.2 30.9,59.2 v3(29.61,57.9)

## Copper pours and planes (outline as drawn; the poured copper is in the pictures)
POWER_GND on Top Layer: outline of 1255 points within 0.05,-0.1 85.01,94.91
POWER_GND on Bottom Layer: outline of 1255 points within 0.05,-0.05 85.01,94.96

## Text on the board
Bottom Silkscreen Layer: JLCJLCJLCJLC | Hackbadge / NUS Greyhats Badge Team / - Restia / - Hackin7
Top Silkscreen Layer: PWN | REV | FORENSICS | CRYPTO | WEBBER | 'hACKBAD6E | 0x41414141
